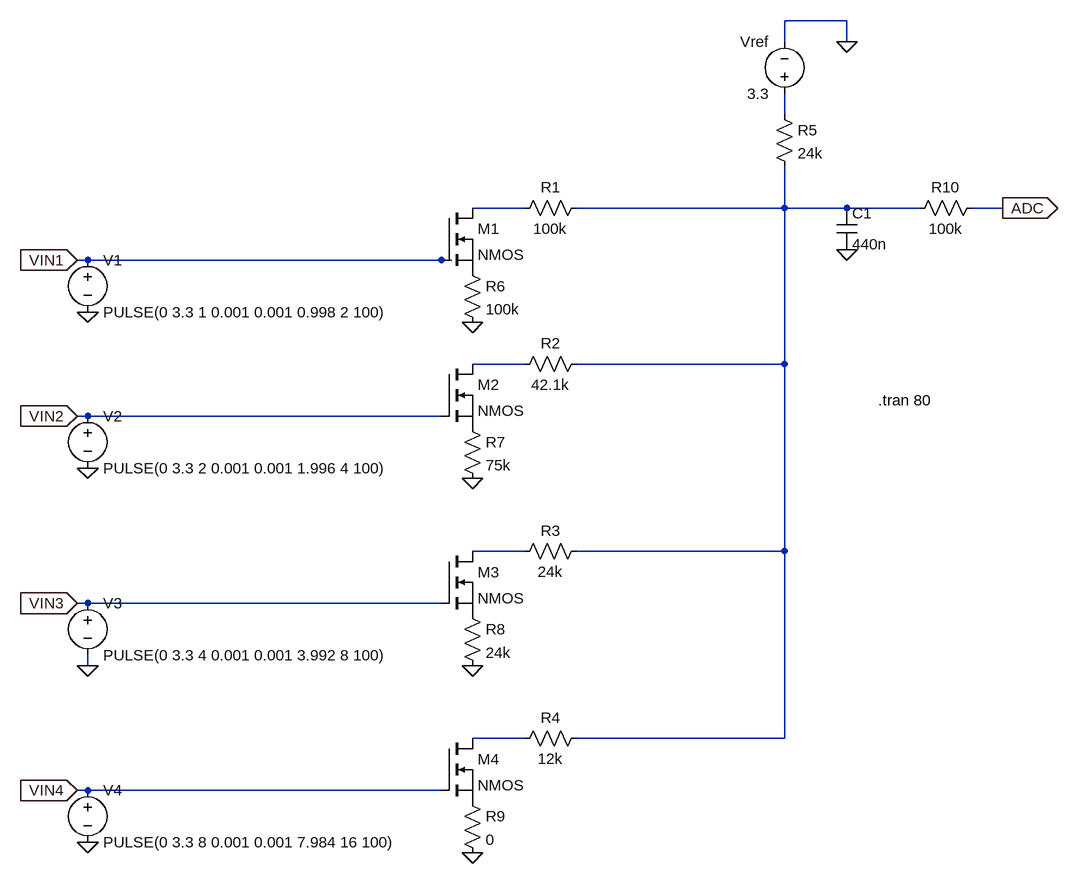
[diagram p0: schematic ADC_Analysis2.asc]
ADC_Analysis2.asc, the LTspice schematic file:
Version 4.1
SHEET 1 1004 932
WIRE 656 -368 560 -368
WIRE 560 -336 560 -368
WIRE 656 -336 656 -368
WIRE 560 -224 560 -256
WIRE 160 -80 80 -80
WIRE 560 -80 560 -144
WIRE 560 -80 240 -80
WIRE 656 -80 560 -80
WIRE 768 -80 656 -80
WIRE 896 -80 848 -80
WIRE -512 0 -528 0
WIRE 32 0 -512 0
WIRE 48 0 32 0
WIRE 160 160 80 160
WIRE 560 160 560 -80
WIRE 560 160 240 160
WIRE -512 240 -528 240
WIRE 32 240 -512 240
WIRE 160 448 80 448
WIRE 560 448 560 160
WIRE 560 448 240 448
WIRE -512 528 -528 528
WIRE 32 528 -512 528
WIRE -512 624 -512 608
WIRE 160 736 80 736
WIRE 560 736 560 448
WIRE 560 736 240 736
WIRE -512 816 -528 816
WIRE 32 816 -512 816
FLAG -528 0 VIN1
IOPIN -528 0 In
FLAG -528 240 VIN2
IOPIN -528 240 In
FLAG -528 528 VIN3
IOPIN -528 528 In
FLAG -528 816 VIN4
IOPIN -528 816 In
FLAG 896 -80 ADC
IOPIN 896 -80 Out
FLAG -512 624 0
FLAG -512 320 0
FLAG -512 80 0
FLAG -512 896 0
FLAG 656 -336 0
FLAG 656 -16 0
FLAG 80 912 0
FLAG 80 624 0
FLAG 80 336 0
FLAG 80 96 0
SYMBOL res 256 -96 R90
WINDOW 0 0 56 VBottom 2
WINDOW 3 32 56 VTop 2
SYMATTR InstName R1
SYMATTR Value 100k
SYMBOL res 256 144 R90
WINDOW 0 0 56 VBottom 2
WINDOW 3 32 56 VTop 2
SYMATTR InstName R2
SYMATTR Value 42.1k
SYMBOL res 256 432 R90
WINDOW 0 0 56 VBottom 2
WINDOW 3 32 56 VTop 2
SYMATTR InstName R3
SYMATTR Value 24k
SYMBOL res 256 720 R90
WINDOW 0 0 56 VBottom 2
WINDOW 3 32 56 VTop 2
SYMATTR InstName R4
SYMATTR Value 12k
SYMBOL voltage -512 -16 R0
WINDOW 123 0 0 Left 0
WINDOW 39 0 0 Left 0
SYMATTR InstName V1
SYMATTR Value PULSE(0 3.3 1 0.001 0.001 0.998 2 100)
SYMBOL voltage -512 224 R0
WINDOW 123 0 0 Left 0
WINDOW 39 0 0 Left 0
SYMATTR InstName V2
SYMATTR Value PULSE(0 3.3 2 0.001 0.001 1.996 4 100)
SYMBOL voltage -512 512 R0
WINDOW 123 0 0 Left 0
WINDOW 39 0 0 Left 0
SYMATTR InstName V3
SYMATTR Value PULSE(0 3.3 4 0.001 0.001 3.992 8 100)
SYMBOL voltage -512 800 R0
WINDOW 123 0 0 Left 0
WINDOW 39 0 0 Left 0
SYMATTR InstName V4
SYMATTR Value PULSE(0 3.3 8 0.001 0.001 7.984 16 100)
SYMBOL res 544 -240 R0
SYMATTR InstName R5
SYMATTR Value 24k
SYMBOL voltage 560 -240 R180
WINDOW 0 24 96 Left 2
WINDOW 3 24 16 Left 2
WINDOW 123 0 0 Left 0
WINDOW 39 0 0 Left 0
SYMATTR InstName Vref
SYMATTR Value 3.3
SYMBOL nmos 32 -80 R0
SYMATTR InstName M1
SYMBOL nmos 32 160 R0
SYMATTR InstName M2
SYMBOL nmos 32 448 R0
SYMATTR InstName M3
SYMBOL nmos 32 736 R0
SYMATTR InstName M4
SYMBOL cap 640 -80 R0
SYMATTR InstName C1
SYMATTR Value 440n
SYMBOL res 64 0 R0
SYMATTR InstName R6
SYMATTR Value 100k
SYMBOL res 64 240 R0
SYMATTR InstName R7
SYMATTR Value 75k
SYMBOL res 64 528 R0
SYMATTR InstName R8
SYMATTR Value 24k
SYMBOL res 64 816 R0
SYMATTR InstName R9
SYMATTR Value 0
SYMBOL res 864 -96 R90
WINDOW 0 0 56 VBottom 2
WINDOW 3 32 56 VTop 2
SYMATTR InstName R10
SYMATTR Value 100k
TEXT 704 216 Left 2 !.tran 80

The netlist it stands for:
* ADC_Analysis2.asc
R1 N003 N002 100k
R2 N003 N004 42.1k
R3 N003 N005 24k
R4 N003 N006 12k
V1 VIN1 0 PULSE(0 3.3 1 0.001 0.001 0.998 2 100)
V2 VIN2 0 PULSE(0 3.3 2 0.001 0.001 1.996 4 100)
V3 VIN3 0 PULSE(0 3.3 4 0.001 0.001 3.992 8 100)
V4 VIN4 0 PULSE(0 3.3 8 0.001 0.001 7.984 16 100)
R5 N001 N003 24k
Vref N001 0 3.3
M1 N002 VIN1 P001 P001 NMOS
M2 N004 VIN2 P002 P002 NMOS
M3 N005 VIN3 P003 P003 NMOS
M4 N006 VIN4 P004 P004 NMOS
C1 N003 0 440n
R6 P001 0 100k
R7 P002 0 75k
R8 P003 0 24k
R9 P004 0 0
R10 ADC N003 100k
.model NMOS NMOS
.model PMOS PMOS
.lib standard.mos
.tran 80
.backanno
.end